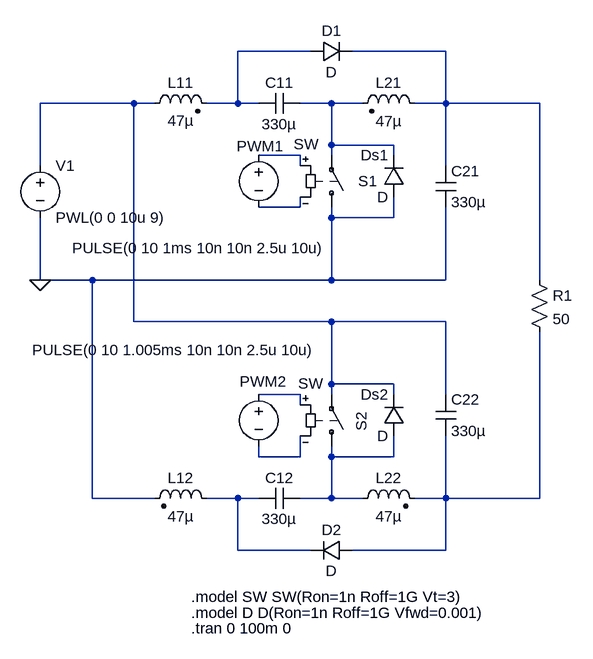
[diagram p0: schematic BC_Type4_ideal_voltage-ratio.asc]
BC_Type4_ideal_voltage-ratio.asc, the LTspice schematic file:
Version 4
SHEET 1 1540 1032
WIRE 384 80 272 80
WIRE 592 80 448 80
WIRE 112 160 -32 160
WIRE 144 160 112 160
WIRE 272 160 272 80
WIRE 272 160 224 160
WIRE 304 160 272 160
WIRE 416 160 368 160
WIRE 464 160 416 160
WIRE 592 160 592 80
WIRE 592 160 544 160
WIRE 736 160 592 160
WIRE 416 224 416 160
WIRE 512 224 416 224
WIRE 368 240 304 240
WIRE 416 240 416 224
WIRE 512 240 512 224
WIRE -32 256 -32 160
WIRE 368 256 368 240
WIRE 592 256 592 160
WIRE 368 320 368 304
WIRE 368 320 304 320
WIRE 416 336 416 320
WIRE 512 336 512 304
WIRE 512 336 416 336
WIRE -32 432 -32 336
WIRE 48 432 -32 432
WIRE 416 432 416 336
WIRE 416 432 48 432
WIRE 592 432 592 320
WIRE 592 432 416 432
WIRE 736 432 736 160
WIRE 112 496 112 160
WIRE 416 496 112 496
WIRE 592 496 416 496
WIRE 416 592 416 496
WIRE 512 592 416 592
WIRE 368 608 304 608
WIRE 416 608 416 592
WIRE 512 608 512 592
WIRE 592 608 592 496
WIRE 368 624 368 608
WIRE 304 704 304 688
WIRE 368 704 368 672
WIRE 368 704 304 704
WIRE 416 704 416 688
WIRE 512 704 512 672
WIRE 512 704 416 704
WIRE 48 768 48 432
WIRE 144 768 48 768
WIRE 272 768 224 768
WIRE 304 768 272 768
WIRE 416 768 416 704
WIRE 416 768 368 768
WIRE 464 768 416 768
WIRE 592 768 592 672
WIRE 592 768 544 768
WIRE 736 768 736 512
WIRE 736 768 592 768
WIRE 272 848 272 768
WIRE 384 848 272 848
WIRE 592 848 592 768
WIRE 592 848 448 848
FLAG -32 432 0
SYMBOL cap 368 144 R90
WINDOW 0 0 32 VBottom 2
WINDOW 3 32 32 VTop 2
SYMATTR InstName C11
SYMATTR Value 330µ
SYMATTR SpiceLine Rser=1m
SYMBOL ind2 560 176 M270
WINDOW 0 32 56 VTop 2
WINDOW 3 4 56 VBottom 2
SYMATTR InstName L21
SYMATTR Value 47µ
SYMATTR Type ind
SYMATTR SpiceLine Rser=1m
SYMATTR SpiceLine2 IC=0
SYMBOL ind2 128 176 R270
WINDOW 0 32 56 VTop 2
WINDOW 3 5 56 VBottom 2
SYMATTR InstName L11
SYMATTR Value 47µ
SYMATTR Type ind
SYMATTR SpiceLine Rser=1m
SYMATTR SpiceLine2 IC=0
SYMBOL cap 576 256 R0
SYMATTR InstName C21
SYMATTR Value 330µ
SYMATTR SpiceLine Rser=1m
SYMBOL cap 304 752 M90
WINDOW 0 0 32 VBottom 2
WINDOW 3 32 32 VTop 2
SYMATTR InstName C12
SYMATTR Value 330µ
SYMATTR SpiceLine Rser=1m
SYMBOL ind2 448 784 R270
WINDOW 0 32 56 VTop 2
WINDOW 3 4 56 VBottom 2
SYMATTR InstName L22
SYMATTR Value 47µ
SYMATTR Type ind
SYMATTR SpiceLine Rser=1m
SYMATTR SpiceLine2 IC=0
SYMBOL ind2 240 784 M270
WINDOW 0 32 56 VTop 2
WINDOW 3 4 56 VBottom 2
SYMATTR InstName L12
SYMATTR Value 47µ
SYMATTR Type ind
SYMATTR SpiceLine Rser=1m
SYMATTR SpiceLine2 IC=0
SYMBOL cap 576 608 R0
SYMATTR InstName C22
SYMATTR Value 330µ
SYMATTR SpiceLine Rser=1m
SYMBOL voltage -32 240 R0
WINDOW 123 0 0 Left 0
WINDOW 39 0 0 Left 0
SYMATTR InstName V1
SYMATTR Value PWL(0 0 10u 9)
SYMBOL res 720 416 R0
SYMATTR InstName R1
SYMATTR Value 50
SYMBOL sw 416 336 M180
WINDOW 0 41 56 Left 2
WINDOW 3 -58 113 Left 2
SYMATTR InstName S1
SYMBOL sw 416 704 M180
WINDOW 0 46 40 VRight 2
WINDOW 3 -51 113 Left 2
SYMATTR InstName S2
SYMBOL voltage 304 224 M0
WINDOW 0 -2 -14 Top 2
WINDOW 3 92 174 Bottom 2
WINDOW 123 0 0 Left 0
WINDOW 39 0 0 Left 0
SYMATTR InstName PWM1
SYMATTR Value PULSE(0 10 1ms 10n 10n 2.5u 10u)
SYMBOL voltage 304 592 M0
WINDOW 0 -7 12 Bottom 2
WINDOW 3 130 -68 Top 2
WINDOW 123 0 0 Left 0
WINDOW 39 0 0 Left 0
SYMATTR InstName PWM2
SYMATTR Value PULSE(0 10 1.005ms 10n 10n 2.5u 10u)
SYMBOL diode 384 96 R270
WINDOW 0 32 32 VTop 2
WINDOW 3 0 32 VBottom 2
SYMATTR InstName D1
SYMBOL diode 448 832 R90
WINDOW 0 0 32 VBottom 2
WINDOW 3 32 32 VTop 2
SYMATTR InstName D2
SYMBOL diode 528 304 R180
WINDOW 0 24 64 Left 2
WINDOW 3 24 0 Left 2
SYMATTR InstName Ds1
SYMBOL diode 528 672 R180
WINDOW 0 24 64 Left 2
WINDOW 3 24 0 Left 2
SYMATTR InstName Ds2
TEXT 200 920 Left 2 !.model SW SW(Ron=1n Roff=1G Vt=3)
TEXT 200 968 Left 2 !.tran 0 100m 0
TEXT 200 944 Left 2 !.model D D(Ron=1n Roff=1G Vfwd=0.001)

The netlist it stands for:
* BC_Type4_ideal_voltage-ratio.asc
C11 N004 N001 330µ Rser=1m
L21 N002 N004 47µ Rser=1m IC=0
L11 N003 N001 47µ Rser=1m IC=0
C21 N002 0 330µ Rser=1m
C12 N010 N009 330µ Rser=1m
L22 N009 N011 47µ Rser=1m IC=0
L12 N010 0 47µ Rser=1m IC=0
C22 N003 N011 330µ Rser=1m
V1 N003 0 PWL(0 0 10u 9)
R1 N002 N011 50
S1 0 N004 N005 N006 SW
S2 N009 N003 N007 N008 SW
V§PWM1 N005 N006 PULSE(0 10 1ms 10n 10n 2.5u 10u)
V§PWM2 N007 N008 PULSE(0 10 1.005ms 10n 10n 2.5u 10u)
D1 N001 N002 D
D2 N011 N010 D
Ds1 0 N004 D
Ds2 N009 N003 D
.model D D
.lib standard.dio
.model SW SW(Ron=1n Roff=1G Vt=3)
.tran 0 100m 0
.model D D(Ron=1n Roff=1G Vfwd=0.001)
.backanno
.end